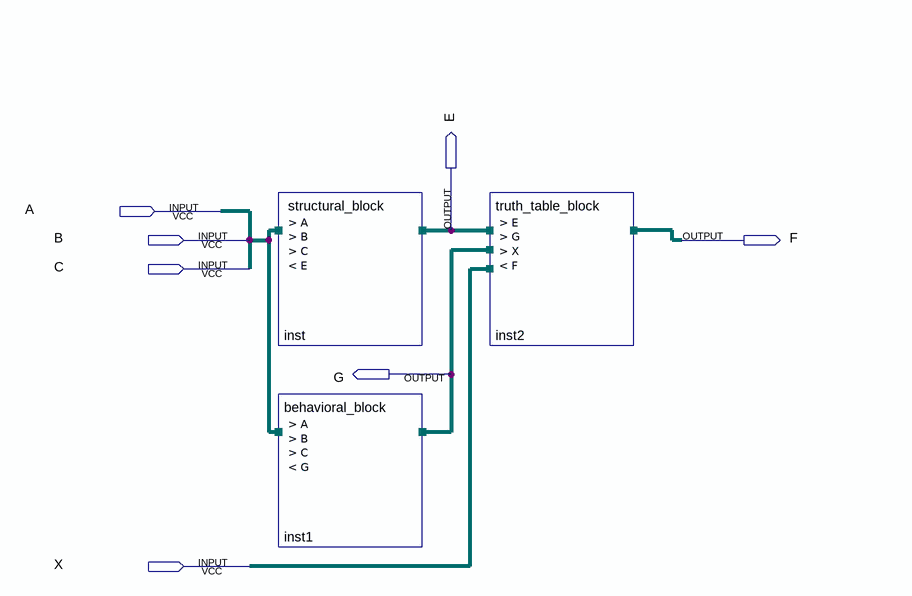
[diagram p0: schematic sheet]
// Quartus schematic lab4.bdf as structural Verilog: 3 symbols, 7 pins
module lab4 (
  input  A,
  input  B,
  input  C,
  input  X,
  output E,
  output F,
  output G
);

  \_structural_block  inst (.A(A), .B(B), .C(C), .E(E));
  behavioral_block inst1 (.A(A), .B(B), .C(C), .G(G));
  truth_table_block inst2 (.E(E), .G(G), .X(X), .F(F));
endmodule
